# Altium schematic sheet power_full.SchDoc
size A4; SheetNumber: 1; SheetTotal: 3
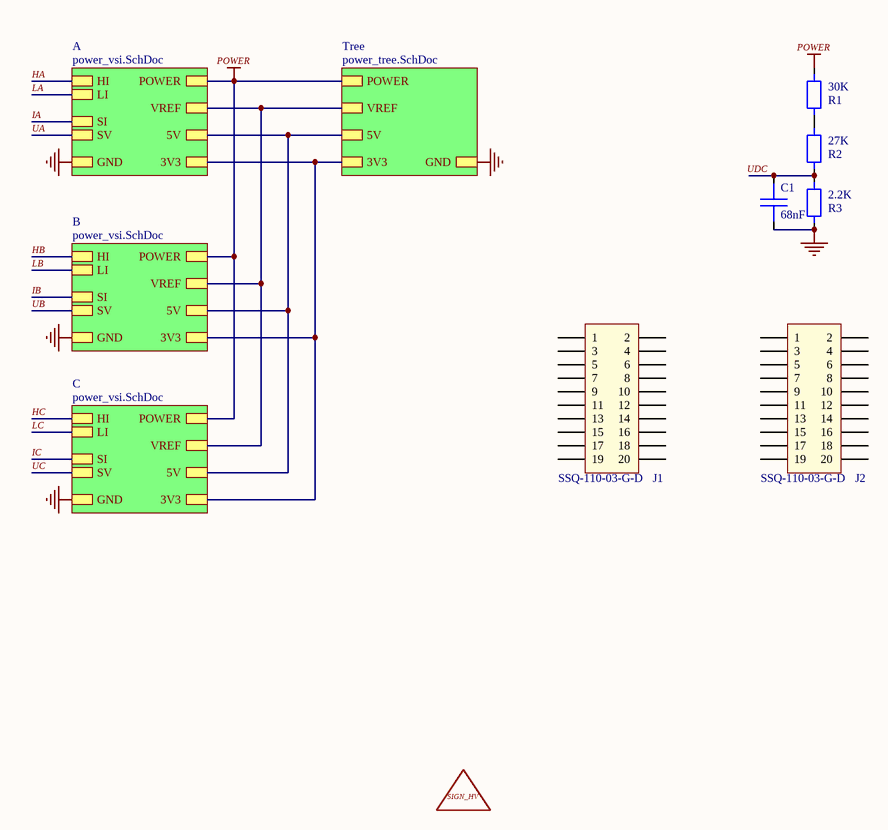
[diagram p0: power_full.SchDoc]

## Parts
C1  68nF  [C0402]
J1  SSQ-110-03-G-D  [HDR-TH_P2.5_20P-Stacking]
J2  SSQ-110-03-G-D  [HDR-TH_P2.5_20P-Stacking]
R1  30K  [R0402]
R2  27K  [R0402]
R3  2.2K  [R0402]
S1  SIGN_HV  [SIGN_HV]  (value not drawn)  (no BOM)

## Sub-sheets
A = power_vsi.SchDoc: HI, LI, SI, POWER, GND, SV, 5V, 3V3, VREF
B = power_vsi.SchDoc: HI, LI, SI, POWER, GND, SV, 5V, 3V3, VREF
C = power_vsi.SchDoc: HI, LI, SI, POWER, GND, SV, 5V, 3V3, VREF
Tree = power_tree.SchDoc: POWER, GND, 5V, 3V3, VREF

## Nets
GND: C1.2 R3.2 ; sheet A/GND, sheet Tree/GND, sheet B/GND, sheet C/GND
POWER: R1.1 ; sheet A/POWER, sheet Tree/POWER, sheet B/POWER, sheet C/POWER
HA: sheet A/HI
HB: sheet B/HI
HC: sheet C/HI
IA: sheet A/SI
IB: sheet B/SI
IC: sheet C/SI
LA: sheet A/LI
LB: sheet B/LI
LC: sheet C/LI
UA: sheet A/SV
UB: sheet B/SV
UC: sheet C/SV
NetC1_1: C1.1 R2.2 R3.1
NetR1_2: R1.2 R2.1
(unnamed): sheet A/5V, sheet Tree/5V, sheet B/5V, sheet C/5V
(unnamed): sheet A/3V3, sheet Tree/3V3, sheet B/3V3, sheet C/3V3
(unnamed): sheet A/VREF, sheet Tree/VREF, sheet B/VREF, sheet C/VREF

Not connected (* = marked no-connect by the designer): J1 10(1) 11(2) 12(3) 13(4) 14(5) 15(6) 16(7) 17(8) 18(9) 19(10) 20(11) 21(12) 22(13) 23(14) 24(15) 25(16) 26(17) 27(18) 28(19) 29(20); J2 10(1) 11(2) 12(3) 13(4) 14(5) 15(6) 16(7) 17(8) 18(9) 19(10) 20(11) 21(12) 22(13) 23(14) 24(15) 25(16) 26(17) 27(18) 28(19) 29(20)

## Notes on the sheet
- Labels drawn without touching a wire or pin: UDC

## Library data of the parts
C1 = Capacitor: 16V, 5%
J1 J2 = TH-20P
R1-R3 = Resistance: 1%